# Altium schematic sheet S5_Memory_Ram.SchDoc
size 420 x 297 mm; SheetNumber: 5; SheetTotal: 11
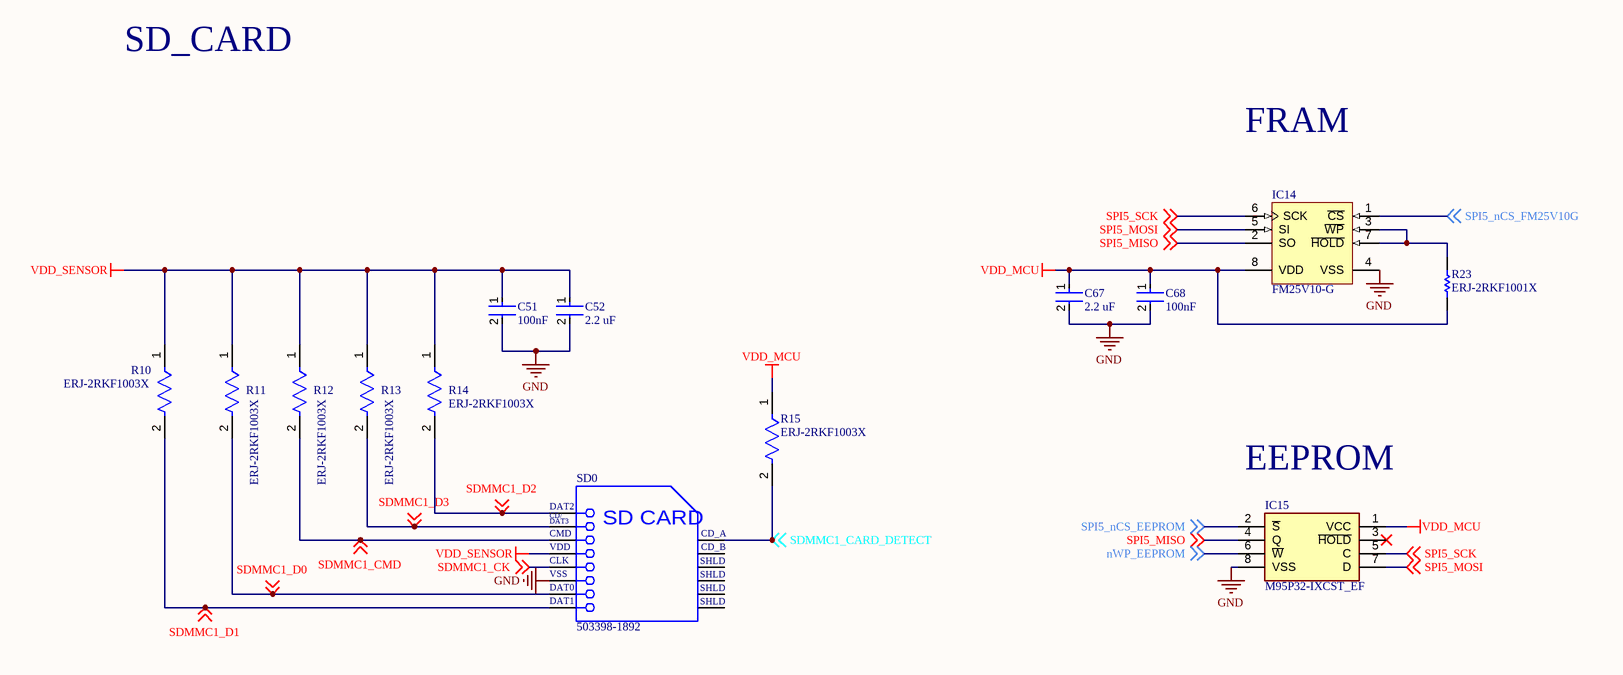
[diagram p0: S5_Memory_Ram.SchDoc]

## Parts
C51  100nF  [FP-CC0402-MFG]
C52  2.2 uF  [FP-C1005-050-IPC_A]
C67  2.2 uF  [FP-C1005-050-IPC_A]
C68  100nF  [FP-CC0402-MFG]
IC14  FM25V10-G  [CYP-S08.15_M]
IC15  M95P32-IXCST_EF  [M95P32IXCSTEF]
R10  ERJ-2RKF1003X  [FP-ERJ2RK-IPC_C]
R11  ERJ-2RKF1003X  [FP-ERJ2RK-IPC_C]
R12  ERJ-2RKF1003X  [FP-ERJ2RK-IPC_C]
R13  ERJ-2RKF1003X  [FP-ERJ2RK-IPC_C]
R14  ERJ-2RKF1003X  [FP-ERJ2RK-IPC_C]
R15  ERJ-2RKF1003X  [FP-ERJ2RK-IPC_C]
R23  ERJ-2RKF1001X  [RESC1005X40X25NL05T05]
SD0  503398-1892  [MOLX-503398-1892_V]

## Nets
GND: C51.2 C52.2 C67.2 C68.2 IC14.4(VSS) IC15.8(VSS) SD0.6(VSS)
VDD_MCU: C67.1 C68.1 IC14.8(VDD) IC15.1(VCC) R15.1 R23.2
VDD_SENSOR: C51.1 C52.1 R10.1 R11.1 R12.1 R13.1 R14.1 SD0.4(VDD)
nWP_EEPROM: IC15.6(~{W}) ; off-sheet nWP_EEPROM
SDMMC1_CARD_DETECT: R15.2 SD0.9(CD_A) ; off-sheet SDMMC1_CARD_DETECT
SDMMC1_CK: SD0.5(CLK) ; off-sheet SDMMC1_CK
SDMMC1_CMD: R12.2 SD0.3(CMD) ; off-sheet SDMMC1_CMD
SDMMC1_D0: R11.2 SD0.7(DAT0) ; off-sheet SDMMC1_D0
SDMMC1_D1: R10.2 SD0.8(DAT1) ; off-sheet SDMMC1_D1
SDMMC1_D2: R14.2 SD0.1(DAT2) ; off-sheet SDMMC1_D2
SDMMC1_D3: R13.2 SD0.2(CD/DAT3) ; off-sheet SDMMC1_D3
SPI5_MISO: IC14.2(SO) IC15.4(Q) ; off-sheet SPI5_MISO
SPI5_MOSI: IC14.5(SI) IC15.7(D) ; off-sheet SPI5_MOSI
SPI5_nCS_EEPROM: IC15.2(~{S}) ; off-sheet SPI5_nCS_EEPROM
SPI5_nCS_FM25V10G: IC14.1(~{CS}) ; off-sheet SPI5_nCS_FM25V10G
SPI5_SCK: IC14.6(SCK) IC15.5(C) ; off-sheet SPI5_SCK
NetIC14_3: IC14.3(~{WP}) IC14.7(~{HOLD}) R23.1

Not connected (* = marked no-connect by the designer): IC15 3(~{HOLD})*; SD0 10(CD_B) 11(SHLD) 12(SHLD) 13(SHLD) 14(SHLD)

## Notes on the sheet
- SD_CARD
- FRAM
- (near IC15) EEPROM
- THIS DOCUMENT AND THE DATA DISCLOSED HEREIN OR
- HEREWITH IS THE PROPERTY OF ALTIUM LIMITED AND MAY
- DWG NO:
- REVISION
- REV:
- DESCRIPTION
- DATE
- APPROVED
- BE FREELY DISTRIBUTED IN WHOLE. NO RIGHTS ARE
- RESERVED OR EXPRESS OR IMPLIED WARANTEE GIVEN.
- ENG:
- APPROVALS
- PROJECT
- DSN:
- CHK:
- REFERENCE DOCUMENTS
- PROJECT REVISION:
- TITLE
- DOCUMENT REVISION:
- DESIGN ITEM:
- BOM:
- FAB DWG:
- PCB DWG:
- ASSY DWG:
- SCALE:
- A3
- SIZE
- CAGE CODE
- FILE NAME
- DWG NO.
- SHEET
- OF
- REV
- (in symbol CMP-2000-05621-1) CD/; DAT3; SD CARD

## Library data of the parts
C51 C68 = CMP-03422-001121-1: CAP CER 0.1UF 16V X7R 0402; Manufacturer: YAGEO; Manufacturer Part Number: CC0402KPX7R7BB104; Material: Ceramic; Temperature Coefficient: 30ppm/°C; Automotive Grade: NA; Tolerance: 0.1; Digikey Description: CAP CER 0.1UF 16V X7R 0402; Temperature Range Low: -55°C; Footprint Url: http://www.yageo.com/exep/pages/download/literatures/UPY-C_GEN_24.pdf; RoHS: TRUE; Device Class L3: Ceramic Capacitors; Temperature Characteristic: X7R; Capacitance: 100 nF; Package: CC0402; Device Class L1: Passive Components; Lead Free: Yes; Temperature Range High: +125°C; Category: Cap; Mouser Description: 0402 0.1 uF 16 V ±10% Tolerance X7R SMT Multilayer Ceramic Capacitor; Voltage Rating: 16 V; Value: 100 nF; ComponentLink2Description: Datasheet; Automotive: No; Octopart: https://octopart.com/cc0402kpx7r7bb104-yageo-21548559; ComponentLink2URL: http://www.yageo.com/documents/recent/UPY-GP_NP0_16V-to-50V_16.pdf; Height: 0.55mm; Device Class L2: Capacitors; Temperature: -55°C to +125°C; Ipc Land Pattern Name: CAPC10050X50
C52 C67 = CMP-08246-004339-1: CAP CER 2.2UF 25V X5R 0402; Dielectric Material: Ceramic; Tolerance: 10%; REACH SVHC: No SVHC; Weight: 2.3E-05oz; Capacitance: 2.2uF; Length: 1mm; RoHS Compliant: Yes; Package Quantity: 1; Voltage Rating (DC): 25V; Dielectric: X5R; Series: C; Voltage Rating: 25V; Case Code (Imperial): 0402; Min Operating Temperature: -55°C; Depth: 0.5mm; Resistor Type: Ceramic; Height: 0.5mm; Width: 0.5mm; Mount: Surface Mount; Case Code (Metric): 1005; Case/Package: 0402; Max Operating Temperature: 85°C; Thickness: 0.022inch; Lead Free: Lead Free; Termination: SMD/SMT; Packaging: Tape and Reel
IC14 = CMP-1640-00001-1: 1-Mbit Serial F-RAM, 2 to 3.6 V, -40 to 85 degC, 8-Pin SOIC (S08.15), RoHS, Tube; Supply Voltage Min: 2 V; Memory Size: 1 Mbits; Access Time: 18 ns; Supply Voltage Max: 3.6 V; Temperature Min: -40 degC; Temperature Max: 85 degC; ComponentLink3Description: Package Specification; Code_JEDEC: MS-012; ComponentLink1Description: Manufacturer URL; RoHS: TRUE; ComponentLink3URL: http://www.mill-max.com/assets/pdfs/metric/007M.PDF; Generic Part Number: FM25V10; ComponentLink1URL: http://www.cypress.com/; PackageDescription: 8-Pin SOIC, Body 4.9 x 3.9 mm, Pitch 1.27 mm; ComponentLink2URL: http://www.cypress.com/file/41691/download; PackageVersion: Rev. *D, 12/2009; ComponentLink2Description: Datasheet; PartNumber: FM25V10-G; Mounting Technology: Surface Mount; Packing: Tube; DatasheetVersion: Rev. *F
IC15 = M95P32-IXCST_EF: Integrated Circuit; Manufacturer_Name: STMicroelectronics; Manufacturer_Part_Number: M95P32-IXCST/EF; Datasheet Link: https://www.st.com/resource/en/datasheet/m95p32-i.pdf; Height: 0.58mm; Mouser Part Number: 511-M95P32-IXCST/EF; Mouser Price/Stock: https://www.mouser.co.uk/ProductDetail/STMicroelectronics/M95P32-IXCST-EF?qs=rQFj71Wb1eVk689cPUP7pg%3D%3D; Arrow Part Number: M95P32-IXCST/EF; Arrow Price/Stock: https://www.arrow.com/en/products/m95p32-ixcstef/stmicroelectronics?utm_currency=USD&region=nac
R10-R15 = CMP-2002-00608-4: RES SMD 100K OHM 1% 1/10W 0402; Resistance: 100kR; Voltage Rating (DC): 50V; Power Rating: 100mW; Temperature Coefficient: 100ppm/°C; Case/Package: 0402; Length: 1mm; Package Quantity: 1; Radiation Hardening: No; Case Code (Metric): 1005; Contact Plating: Tin; Mount: Surface Mount; Depth: 0.5mm; Max Operating Temperature: 155°C; Lead Free: Lead Free; Width: 0.5mm; Composition: Thick Film; Case Code (Imperial): 0402; Tolerance: 1%; Termination: SMD/SMT; Number of Pins: 2; Height: 0.35mm; Voltage Rating: 50V; Military Standard: Not; REACH SVHC: No SVHC; Packaging: Tape and Reel; Min Operating Temperature: -55°C; Max Power Dissipation: 100mW; Features: Automotive AEC-Q200; Number of Terminations: 2
R23 = CMP-1011-00510-4: Chip Resistor, 1 KOhm, +/- 1%, 100 mW, -55 to 155 degC, 0402 (1005 Metric), RoHS, Tape and Reel; Manufacturer: Basic Passives; Voltage Rating: 50 V; Case\/Package: 0402; Resistance: 1 KOhm; Power Rating: 100 mW; PartNumber: ERJ-2RKF1001X; DatasheetVersion: 04/2015; Radiation Hardening: No; Pins: 2; Height: 0.35 mm; RoHSCompliant: true; Case Code (Imperial): 0402; ComponentLink2Description: Datasheet; ComponentLink1Description: Manufacturer URL; PackageReference: 0402; Mount: Surface Mount; Package Quantity: 10000; Tolerance: 1%; ComponentLink1URL: http://www.panasonic.com/; PackageDescription: 2-Pin Surface Mount Device, Body 1 x 0.5 mm; Mounting Technology: Surface Mount; Case Code (Metric): 1005; ComponentLink2URL: http://industrial.panasonic.com/cdbs/www-data/pdf/RDA0000/AOA0000C86.pdf; REACH SVHC: Yes; Packaging: Tape and Reel; Max Operating Temperature: 155 degC; Min Operating Temperature: -55 degC; Width: 0.5 mm; Length: 1 mm
SD0 = CMP-2000-05621-1: Micro SD Connector, Pitch 1.1 mm, 8 Position, Height 1.4 mm, -25 to 85 degC, RoHS, Tape and Reel; Manufacturer: Molex; Voltage Rating: 10VAC/DC; Current Rating: 500mA; Manufacturer URL: http://www.molex.com/; Package Reference: 503398-1892; Packaging: Reel; RoHS: Details; Brand: Molex; Datasheet URL: http://www.molex.com/pdm_docs/sd/5033981892_sd.pdf; Mounting Technology: SurfaceMount; Factory Pack Quantity: 2400; Datasheet Version: Rev. E, 04/2006; Series: 503398; Product Category: MemoryCardConnectors; Package Description: Micro SD Connector, Pitch 1.1 mm, 8 Position, Height 1.4 mm